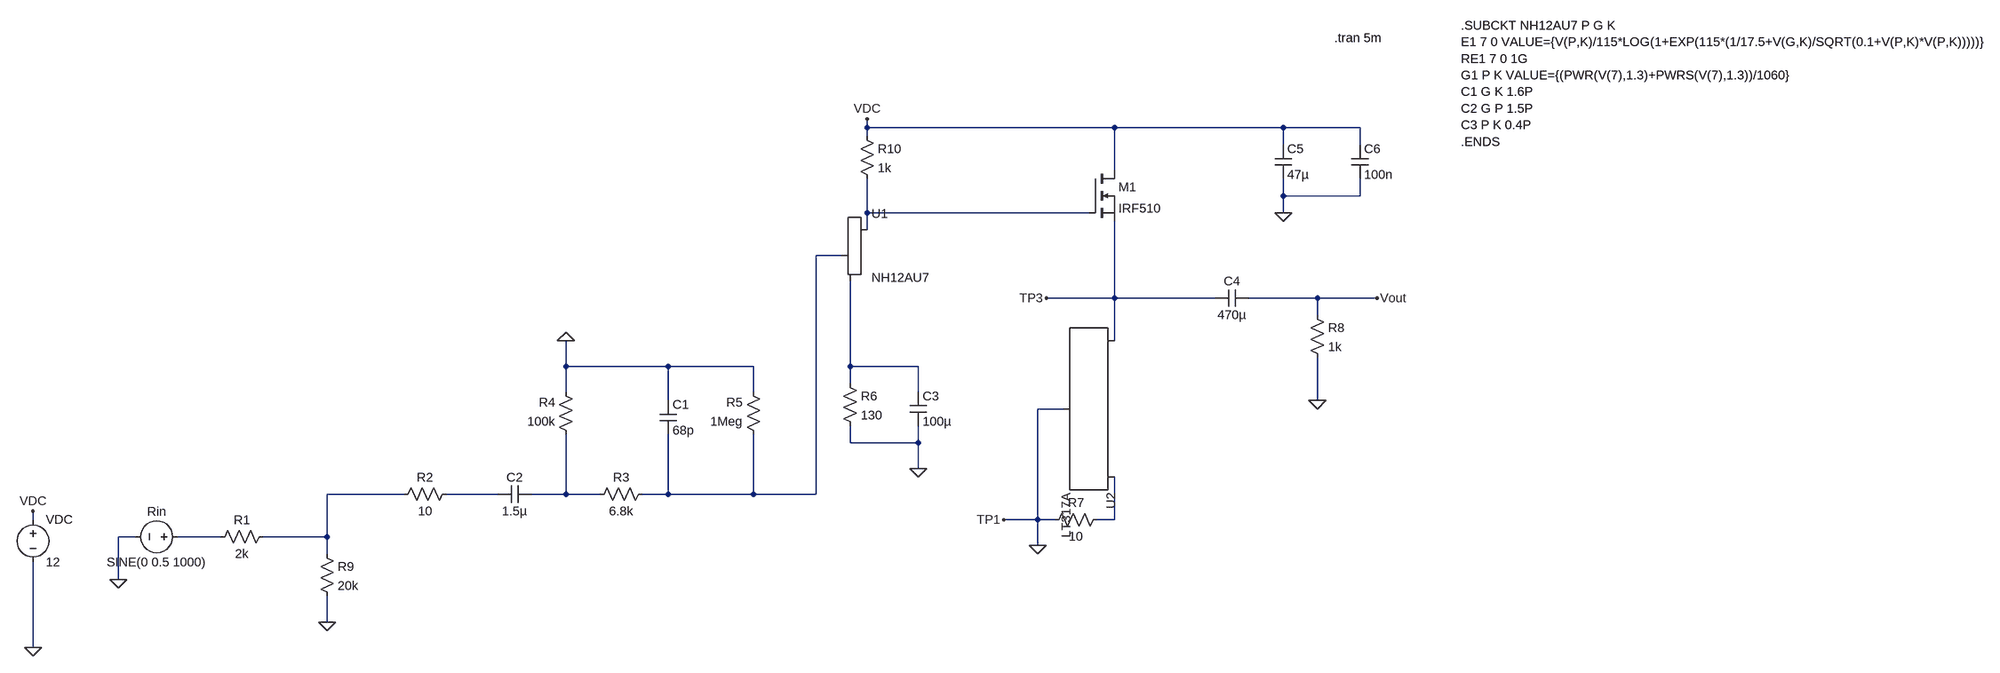
[diagram p0: schematic Schemativ_1.asc]
Schemativ_1.asc, the LTspice schematic file:
Version 4.1
SHEET 1 4052 680
WIRE 1824 -624 1824 -640
WIRE 2288 -624 1824 -624
WIRE 2608 -624 2288 -624
WIRE 2752 -624 2608 -624
WIRE 1824 -608 1824 -624
WIRE 2608 -592 2608 -624
WIRE 2752 -592 2752 -624
WIRE 2288 -544 2288 -624
WIRE 2608 -496 2608 -528
WIRE 2752 -496 2752 -528
WIRE 2752 -496 2608 -496
WIRE 1824 -464 1824 -528
WIRE 2240 -464 1824 -464
WIRE 2608 -464 2608 -496
WIRE 1824 -432 1824 -464
WIRE 1776 -384 1728 -384
WIRE 2288 -304 2288 -448
WIRE 2288 -304 2160 -304
WIRE 2480 -304 2288 -304
WIRE 2672 -304 2544 -304
WIRE 2784 -304 2672 -304
WIRE 2672 -272 2672 -304
WIRE 2288 -224 2288 -304
WIRE 1072 -176 1072 -224
WIRE 1264 -176 1072 -176
WIRE 1424 -176 1264 -176
WIRE 1792 -176 1792 -336
WIRE 1920 -176 1792 -176
WIRE 1792 -144 1792 -176
WIRE 1072 -128 1072 -176
WIRE 1424 -128 1424 -176
WIRE 1920 -128 1920 -176
WIRE 1264 -112 1264 -176
WIRE 2672 -112 2672 -192
WIRE 2192 -96 2144 -96
WIRE 1792 -32 1792 -64
WIRE 1920 -32 1920 -64
WIRE 1920 -32 1792 -32
WIRE 1920 16 1920 -32
WIRE 768 64 624 64
WIRE 944 64 848 64
WIRE 1072 64 1072 -48
WIRE 1072 64 1008 64
WIRE 1136 64 1072 64
WIRE 1264 64 1264 -48
WIRE 1264 64 1216 64
WIRE 1424 64 1424 -48
WIRE 1424 64 1264 64
WIRE 1728 64 1728 -384
WIRE 1728 64 1424 64
WIRE 64 112 64 96
WIRE 2144 112 2144 -96
WIRE 2144 112 2080 112
WIRE 2176 112 2144 112
WIRE 2288 112 2288 32
WIRE 2288 112 2256 112
WIRE 256 144 224 144
WIRE 416 144 336 144
WIRE 624 144 624 64
WIRE 624 144 496 144
WIRE 2144 160 2144 112
WIRE 624 176 624 144
WIRE 224 224 224 144
WIRE 624 304 624 256
WIRE 64 352 64 192
FLAG 64 96 VDC
FLAG 64 352 0
FLAG 224 224 0
FLAG 1072 -224 0
FLAG 1920 16 0
FLAG 2144 160 0
FLAG 2672 -112 0
FLAG 624 304 0
FLAG 1824 -640 VDC
FLAG 2608 -464 0
FLAG 2784 -304 Vout
FLAG 2080 112 TP1
FLAG 2160 -304 TP3
SYMBOL voltage 64 96 R0
WINDOW 123 0 0 Left 0
WINDOW 39 0 0 Left 0
SYMATTR InstName VDC
SYMATTR Value 12
SYMBOL voltage 352 144 R90
WINDOW 0 -32 56 VBottom 2
WINDOW 3 32 56 VTop 2
WINDOW 123 0 0 Left 0
WINDOW 39 0 0 Left 0
SYMATTR InstName Rin
SYMATTR Value SINE(0 0.5 1000)
SYMBOL res 512 128 R90
WINDOW 0 0 56 VBottom 2
WINDOW 3 32 56 VTop 2
SYMATTR InstName R1
SYMATTR Value 2k
SYMBOL res 864 48 R90
WINDOW 0 0 56 VBottom 2
WINDOW 3 32 56 VTop 2
SYMATTR InstName R2
SYMATTR Value 10
SYMBOL res 1232 48 R90
WINDOW 0 0 56 VBottom 2
WINDOW 3 32 56 VTop 2
SYMATTR InstName R3
SYMATTR Value 6.8k
SYMBOL res 1088 -32 R180
WINDOW 0 36 76 Left 2
WINDOW 3 36 40 Left 2
SYMATTR InstName R4
SYMATTR Value 100k
SYMBOL res 1440 -32 R180
WINDOW 0 36 76 Left 2
WINDOW 3 36 40 Left 2
SYMATTR InstName R5
SYMATTR Value 1Meg
SYMBOL cap 1248 -112 R0
SYMATTR InstName C1
SYMATTR Value 68p
SYMBOL cap 1008 48 R90
WINDOW 0 0 32 VBottom 2
WINDOW 3 32 32 VTop 2
SYMATTR InstName C2
SYMATTR Value 1.5µ
SYMBOL Misc\\triode 1824 -384 R0
SYMATTR InstName U1
SYMATTR Value NH12AU7
SYMBOL res 1776 -160 R0
SYMATTR InstName R6
SYMATTR Value 130
SYMBOL cap 1904 -128 R0
SYMATTR InstName C3
SYMATTR Value 100µ
SYMBOL nmos 2240 -544 R0
SYMATTR InstName M1
SYMATTR Value IRF510
SYMBOL PowerProducts\\LT317A 2288 -96 R90
SYMATTR InstName U2
SYMBOL res 2272 96 R90
WINDOW 0 0 56 VBottom 2
WINDOW 3 32 56 VTop 2
SYMATTR InstName R7
SYMATTR Value 10
SYMBOL cap 2544 -320 R90
WINDOW 0 0 32 VBottom 2
WINDOW 3 32 32 VTop 2
SYMATTR InstName C4
SYMATTR Value 470µ
SYMBOL res 2656 -288 R0
SYMATTR InstName R8
SYMATTR Value 1k
SYMBOL res 608 160 R0
SYMATTR InstName R9
SYMATTR Value 20k
SYMBOL res 1808 -624 R0
SYMATTR InstName R10
SYMATTR Value 1k
SYMBOL cap 2592 -592 R0
SYMATTR InstName C5
SYMATTR Value 47µ
SYMBOL cap 2736 -592 R0
SYMATTR InstName C6
SYMATTR Value 100n
TEXT 2704 -792 Left 2 !.tran 5m
TEXT 2968 -816 Left 2 !.SUBCKT NH12AU7 P G K\nE1 7 0 VALUE={V(P,K)/115*LOG(1+EXP(115*(1/17.5+V(G,K)/SQRT(0.1+V(P,K)*V(P,K)))))}\nRE1 7 0 1G\nG1 P K VALUE={(PWR(V(7),1.3)+PWRS(V(7),1.3))/1060}\nC1 G K 1.6P\nC2 G P 1.5P\nC3 P K 0.4P\n.ENDS

The netlist it stands for:
* Schemativ_1.asc
VDC VDC 0 12
V§Rin N008 0 SINE(0 0.5 1000)
R1 N004 N008 2k
R2 N005 N004 10
R3 N002 N006 6.8k
R4 N006 0 100k
R5 N002 0 1Meg
C1 0 N002 68p
C2 N006 N005 1.5µ
X§U1 N001 N002 N003 NH12AU7
R6 N003 0 130
C3 N003 0 100µ
M1 VDC N001 TP3 TP3 IRF510
X§U2 0 N007 TP3 LT317A
R7 N007 0 10
C4 Vout TP3 470µ
R8 Vout 0 1k
R9 N004 0 20k
R10 VDC N001 1k
C5 VDC 0 47µ
C6 VDC 0 100n
.model NMOS NMOS
.model PMOS PMOS
.lib standard.mos
.tran 5m
.SUBCKT NH12AU7 P G K
E1 7 0 VALUE={V(P,K)/115*LOG(1+EXP(115*(1/17.5+V(G,K)/SQRT(0.1+V(P,K)*V(P,K)))))}
RE1 7 0 1G
G1 P K VALUE={(PWR(V(7),1.3)+PWRS(V(7),1.3))/1060}
C1 G K 1.6P
C2 G P 1.5P
C3 P K 0.4P
.ENDS
.lib LTC.lib
.backanno
.end